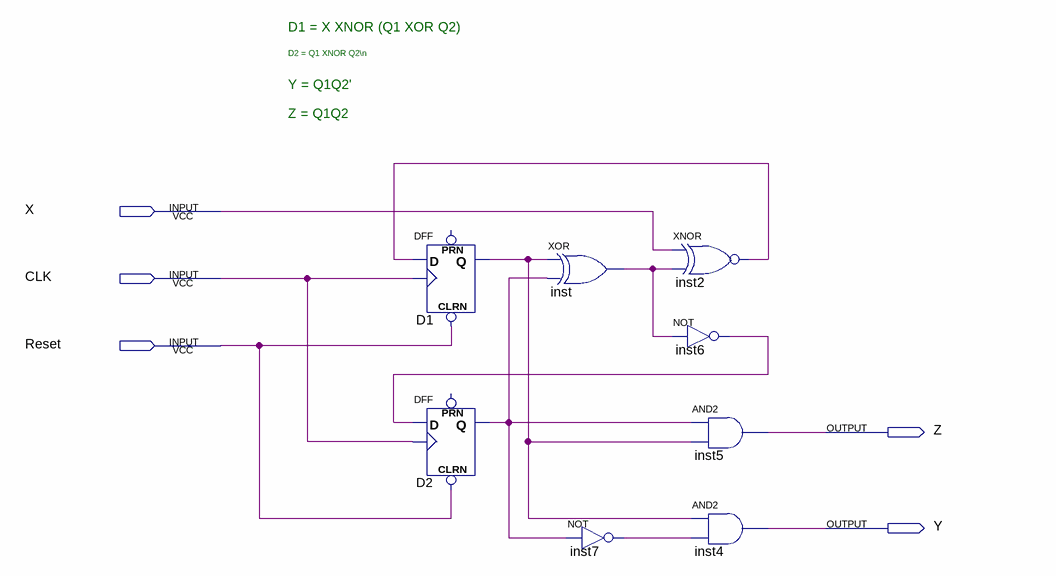
[diagram p0: schematic sheet]
// Quartus schematic CHF_Assign3.bdf as structural Verilog: 8 symbols, 5 pins
module CHF_Assign3 (
  input  X,
  input  CLK,
  input  Reset,
  output Z,
  output Y
);

  wire D1_q, D2_q, inst2_out, inst6_out, inst7_out, inst_out;

  DFF D1 (.CLRN(Reset), .CLK(CLK), .D(inst2_out), .Q(D1_q));  // open: PRN
  DFF D2 (.CLRN(Reset), .CLK(CLK), .D(inst6_out), .Q(D2_q));  // open: PRN
  xor inst (inst_out, D1_q, D2_q);
  not inst7 (inst7_out, D2_q);
  xnor inst2 (inst2_out, X, inst_out);
  not inst6 (inst6_out, inst_out);
  and inst5 (Z, D2_q, D1_q);
  and inst4 (Y, D1_q, inst7_out);

  // Notes on the sheet:
  //   D1 = X XNOR (Q1 XOR Q2)                                                           
  //   D2 = Q1 XNOR Q2\n                                                 
  //   Y = Q1Q2'                   
  //   Z = Q1Q2                         
endmodule
